# Altium project V3_Board.PrjPcb (part 3 of 9)

## Sheet Reverse Protection_Section.SchDoc
size A4; DocumentNumber: 3; SheetNumber: 3; SheetTotal: 17
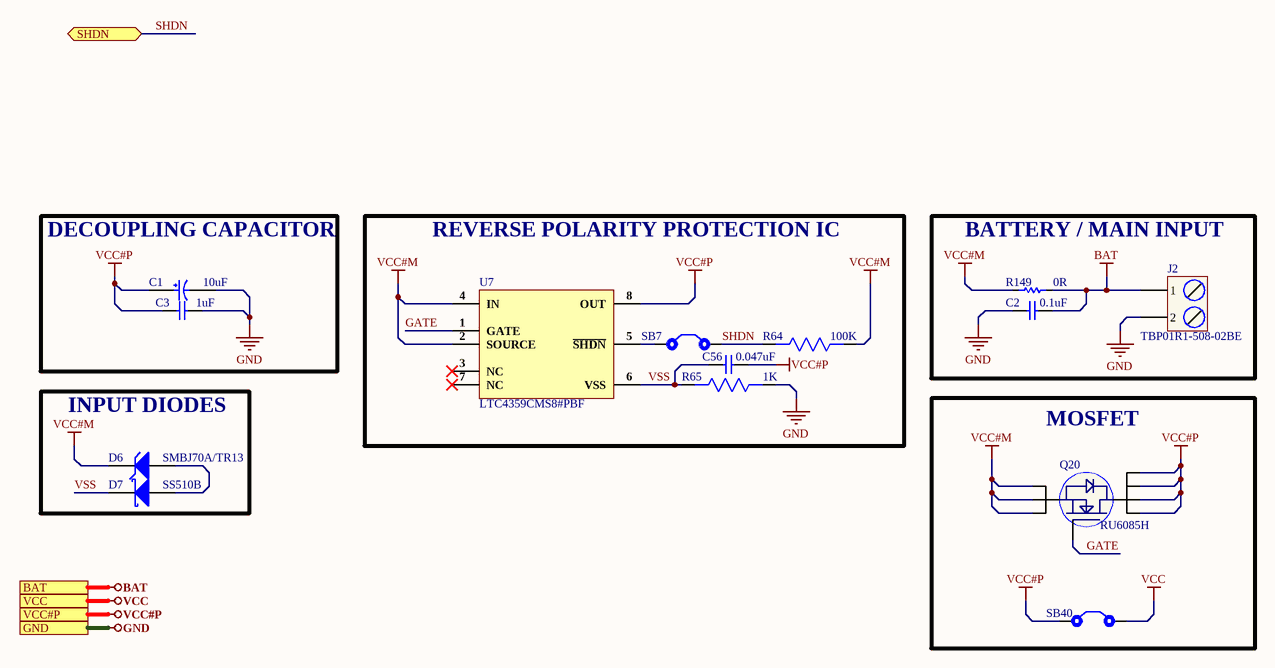
[diagram p5: Reverse Protection_Section.SchDoc]

### Parts
C1  10uF  [RVT1E100M0405.]
C2  0.1uF  [Cap-1206]
C3  1uF  [Cap0603]
C56  0.047uF  [Cap-1206]
D6  SMBJ70A/TR13  [SMB]
D7  SS510B  [SS510B]
J2  TBP01R1-508-02BE  [TBP01R1-508-02BE]
Q20  RU6085H  [RU6085H]
R64  100K  [RES-0805]
R65  1K  [Res-1206]
R149  0R  [RES-2512]
SB7  Solder Bridge  [Solder Bridge]  (value not drawn)
SB40  Solder Bridge  [Solder Bridge]  (value not drawn)
U7  LTC4359CMS8#PBF  [LTC4359CMS8#PBF]

### Blocks framed on the sheet
DECOUPLING CAPACITOR: C1 C3
REVERSE POLARITY PROTECTION IC: C56 R64 R65 SB7 U7
BATTERY / MAIN INPUT: C2 J2 R149
INPUT DIODES: D6 D7
MOSFET: Q20 SB40

### Ports
BAT, GND, SHDN (bidir), VCC, VCC#P

### Nets
BAT: C2.2 J2.1 R149.2 ; port BAT
GND: C1.2 C2.1 C3.2 J2.2 R65.1 ; port GND
VCC: SB40.2 ; port VCC
VCC#M: D6.1(K) Q20.1(S) Q20.2(S) Q20.3(S) R64.1 R149.1 U7.2(SOURCE) U7.4(IN)
VCC#P: C1.1 C3.1 C56.2 Q20.5(D) Q20.6(D) Q20.7(D) Q20.8(D) SB40.1 U7.8(OUT) ; port VCC#P
GATE: Q20.4(G) U7.1(GATE)
SHDN: R64.2 SB7.2 ; port SHDN
VSS: C56.1 D7.1(K) R65.2 U7.6(VSS)
NetD6_2: D6.2(A) D7.2(A)
NetSB7_1: SB7.1 U7.5(~{SHDN})

Not connected (* = marked no-connect by the designer): U7 3(NC)* 7(NC)*

### Library data of the parts
C1 = RVT1E100M0405: CAP ALUM 10uF 25V SMD; Manufacturer: ROQANG; φD: 4mm; L: 5.4mm; Tolerance: ±20%; Operating Temperature: -45℃~+105℃; Rated Voltage: 25V; Capacitance: 10uF
C2 = CC1206KKX7R0BB104: CAP CER 0.1UF 100V X7R 1206; Manufacturer: Yageo; Dielectric Material: Ceramic; Tolerance: 10%; Voltage: 63V; Capacitance: 100nF; Item Type: Capacitor; Supplier 1: Avnet; Manufacturer Part Number: CC1206KKX7R0BB104; RoHS: Yes; Category: Ceramic Capacitors; Stock 1: 24000; Pricing 1: 3000=0.01588, 6000=0.01565, 12000=0.01520, 18000=0.01486, 24000=0.01429, 30000=0.01395, 300000=0.01361 (USD); Mount: Surface Mount; Case/Package: 1206; Number of Pins: 2; Case Code (Metric): 3216; Case Code (Imperial): 1206; Min Operating Temperature: -55°C; Max Operating Temperature: 125°C; Dielectric: X7R; Package Quantity: 1; Voltage Rating: 100V; Packaging: Tape and Reel; Voltage Rating (DC): 100V; Termination: SMD/SMT; Resistor Type: Ceramic; Series: CC; Length: 3.2mm; Width: 0.063inch; Height: 1.25mm; Thickness: 0.057inch; Depth: 1.6mm; Radiation Hardening: No; RoHS Compliant: Yes; Reach SVHC Compliant: Yes; Lead Free: Lead Free; ComponentLink1URL: https://datasheet.ciiva.com/7978/1447671-7978227.pdf?src-supplier=Element14; ComponentLink1Description: https://datasheet.ciiva.com/7978/1447671-7978227.pdf?src-supplier=Element14; ComponentLink2URL: https://datasheet.ciiva.com/46391/1919308-46391993.pdf?src-supplier=Element14; ComponentLink2Description: https://datasheet.ciiva.com/46391/1919308-46391993.pdf?src-supplier=Element14; ComponentLink3URL: https://datasheet.ciiva.com/180/mlccorderingcode-180145.pdf?src-supplier=Digi-Key; ComponentLink3Description: https://datasheet.ciiva.com/180/mlccorderingcode-180145.pdf?src-supplier=Digi-Key; ComponentLink4URL: https://datasheet.ciiva.com/180/mlccorderingcode-180144.pdf?src-supplier=Digi-Key; ComponentLink4Description: https://datasheet.ciiva.com/180/mlccorderingcode-180144.pdf?src-supplier=Digi-Key; ComponentLink5URL: https://datasheet.ciiva.com/180/mlccorderingcode-180146.pdf?src-supplier=Digi-Key; ComponentLink5Description: https://datasheet.ciiva.com/180/mlccorderingcode-180146.pdf?src-supplier=Digi-Key; ComponentLink6URL: https://datasheet.ciiva.com/5425/upy-gp-np0-16v-to-50v-8-5425573.pdf?src-supplier=Mouser; ComponentLink6Description: https://datasheet.ciiva.com/5425/upy-gp-np0-16v-to-50v-8-5425573.pdf?src-supplier=Mouser; ComponentLink7URL: https://datasheet.ciiva.com/16981/upy-np0x7r-mv-100-to-630v-9-16981180.pdf?src-supplier=Future+Electronics; ComponentLink7Description: https://datasheet.ciiva.com/16981/upy-np0x7r-mv-100-to-630v-9-16981180.pdf?src-supplier=Future+Electronics; ComponentLink8URL: https://datasheet.ciiva.com/26829/getdatasheetpartid-403790-26829655.pdf?src-supplier=Verical; ComponentLink8Description: https://datasheet.ciiva.com/26829/getdatasheetpartid-403790-26829655.pdf?src-supplier=Verical; Supplier Part Number 1: CC1206KKX7R0BB104; LCSC Part Number: C107181
C3 = CC0603KRX5R8BB105: CAP CER 1UF 25V X5R 0603; Manufacturer: Yageo; Tolerance: 10%; Supplier 1: Digi-Key; Manufacturer Part Number: CC0603KRX5R8BB105; Stock 1: 1419041; Pricing 1: 1=0.1, 10=0.069, 100=0.0307, 500=0.0219, 1000=0.0172 (USD); Mount: Surface Mount; Case/Package: 0603; Number of Pins: 2; Case Code (Metric): 1608; Case Code (Imperial): 0603; Min Operating Temperature: -55°C; Max Operating Temperature: 85°C; Capacitance: 1uF; Dielectric: X5R; Package Quantity: 1; Voltage Rating: 25V; Packaging: Tape and Reel; Termination: SMD/SMT; Voltage Rating (DC): 25V; Length: 1.6mm; Height: 0.8mm; Width: 0.031inch; Thickness: 0.035inch; Depth: 0.8mm; Radiation Hardening: No; REACH SVHC: No SVHC; Lead Free: Lead Free; Halogen Free: Halogen Free; ComponentLink1URL: http://www.yageo.com/documents/recent/UPY-GPHC_X5R_4V-to-50V_25.pdf?src-supplier=Digi-Key; ComponentLink1Description: http://www.yageo.com/documents/recent/UPY-GPHC_X5R_4V-to-50V_25.pdf?src-supplier=Digi-Key; ComponentLink2URL: http://www.yageo.com/documents/recent/UPY-GPHC_X5R_4V-to-50V_12.pdf?src-supplier=Avnet+Europe; ComponentLink2Description: http://www.yageo.com/documents/recent/UPY-GPHC_X5R_4V-to-50V_12.pdf?src-supplier=Avnet+Europe; ComponentLink3URL: http://www.farnell.com/datasheets/1525783.pdf?src-supplier=Element14; ComponentLink3Description: http://www.farnell.com/datasheets/1525783.pdf?src-supplier=Element14; ComponentLink4URL: http://www.yageo.com/documents/recent/UPY-GPHC_X5R_4V-to-50V_12.pdf?src-supplier=Avnet; ComponentLink4Description: http://www.yageo.com/documents/recent/UPY-GPHC_X5R_4V-to-50V_12.pdf?src-supplier=Avnet; Supplier Part Number 1: 311-1445-6-ND
C56 = CC1206JRX7R0BB473: CAP CER 0.047UF 100V X7R 1206; Manufacturer: Yageo; Tolerance: 5%; Capacitance: 47nF; Item Type: Capacitor; Supplier 1: Arrow Electronics; Manufacturer Part Number: CC1206JRX7R0BB473; RoHS: Yes; Category: Ceramic Capacitors; Stock 1: 6600; Pricing 1: 1=0.21620, 10=0.10530, 25=0.10420, 100=0.08480, 250=0.08390, 500=0.05860, 1000=0.05090, 3000=0.04900, 6000=0.02930 (USD); Mount: Surface Mount; Case/Package: 1206; Case Code (Imperial): 1206; Case Code (Metric): 3216; Min Operating Temperature: -55°C; Max Operating Temperature: 125°C; Packaging: Tape and Reel; Voltage Rating (DC): 100V; Dielectric: X7R; Termination: SMD/SMT; Resistor Type: Ceramic; Voltage Rating: 100V; Series: CC; Construction: Flat; Length: 3.2mm; Width: 1.6mm; Height: 0.85mm; Thickness: 0.037inch; Depth: 1.6mm; Radiation Hardening: No; RoHS Compliant: Yes; ComponentLink1URL: https://datasheet.ciiva.com/11465/upy-np0x7r-mv-100-to-630v-9-11465413.pdf?src-supplier=Avnet; ComponentLink1Description: https://datasheet.ciiva.com/11465/upy-np0x7r-mv-100-to-630v-9-11465413.pdf?src-supplier=Avnet; ComponentLink2URL: https://datasheet.ciiva.com/13210/upy-gp-np0-16v-to-50v-8-13210277.pdf?src-supplier=Mouser; ComponentLink2Description: https://datasheet.ciiva.com/13210/upy-gp-np0-16v-to-50v-8-13210277.pdf?src-supplier=Mouser; Supplier Part Number 1: CC1206JRX7R0BB473; LCSC Part Number: C577197
D6 = SMBJ70A/TR13: 1uA 5.3A 113V 77.8V 70V 86V Unidirectional SMB(DO-214AA) TVS ROHS; Manufacturer: Brightking; Manufacturer Part Number: SMBJ70A/TR13; Footprint: SMB(DO-214AA); ComponentLink1Description: LCSC; ComponentLink1URL: https://www.lcsc.com/product-detail/TVS_Brightking-SMBJ70A-TR13_C309982.html
D7 = SS510B: SCHOTTKY DIODE SMB 100V 5A; Manufacturer: MDD; Manufacturer Part Number: SS510B; Footprint: SMB; ComponentLink1Description: LCSC; ComponentLink1URL: https://lcsc.com/product-detail/Schottky-Barrier-Diodes-SBD_WEIDA-SS510B_C2915231.html
J2 = TBP01R1-508-02BE: TERMINAL BLOCK, PLUGGABLE, 5.08,; Manufacturer: CUI Devices; Supplier 1: Arrow Electronics; Manufacturer Part Number: TBP01R1-508-02BE; RoHS: Yes; Category: Terminal Blocks; Stock 1: 1821; Pricing 1: 1=0.57450, 10=0.23530, 25=0.18730, 50=0.17170, 100=0.16040, 400=0.14010, 800=0.12060, 1200=0.11290 (USD); Supplier Part Number 1: TBP01R1-508-02BE
Q20 = RU6085H: 60V 80A 2.5W 7mΩ@10V,20A 3V@250μA N Channel SOP-8_150mil MOSFETs ROHS; Manufacturer: Shenzhen; Manufacturer Part Number: RU6085H; Footprint: SOP-8_150mil; ComponentLink1Description: LCSC; ComponentLink1URL: https://lcsc.com/product-detail/MOSFETs_Shenzhen-ruichips-Semicon-RU6085H_C181990.html
R64 = RC0805FR-07100KL: RES 100K OHM 1% 1/8W 0805; Manufacturer: Yageo; Resistance: 100kR; Power Rating: 125mW; Voltage Rating (DC): 150V; Temperature Coefficient: 100ppm/°C; Item Type: Resistor; Supplier 1: Avnet; Manufacturer Part Number: RC0805FR-07100KL; RoHS: Yes; Category: Chip SMD Resistors; Stock 1: 695000; Pricing 1: 5000=0.00227, 10000=0.00224, 20000=0.00217 (USD); Case/Package: 0805; Number of Pins: 2; Case Code (Metric): 2012; Case Code (Imperial): 0805; Size Code: 0805; Min Operating Temperature: -55°C; Max Operating Temperature: 155°C; Resistor Type: Thick Film; Tolerance: 1%; Packaging: Tape and Reel; Voltage Rating: 150V; Package Quantity: 1; Number of Terminations: 2; Termination: SMD/SMT; Max Power Dissipation: 125mW; Features: Moisture Resistant; Series: RC; Construction: Rectangular; Resistance Tolerance: 1%; Technology: THICK FILM; Length: 0.079inch; Width: 0.049inch; Height: 0.024inch; Depth: 1.25mm; Lead Pitch: 0.4mm; Lead Free: Lead Free; RoHS Compliant: Yes; Military Standard: Not; ComponentLink1URL: https://datasheet.ciiva.com/11808/0900766b8106beab-11808858.pdf?src-supplier=RSComponents; ComponentLink1Description: https://datasheet.ciiva.com/11808/0900766b8106beab-11808858.pdf?src-supplier=RSComponents; ComponentLink2URL: https://datasheet.ciiva.com/7941/1686128-7941677.pdf?src-supplier=Element14; ComponentLink2Description: https://datasheet.ciiva.com/7941/1686128-7941677.pdf?src-supplier=Element14; ComponentLink3URL: https://datasheet.ciiva.com/7660/38627-7660796.pdf?src-supplier=Element14; ComponentLink3Description: https://datasheet.ciiva.com/7660/38627-7660796.pdf?src-supplier=Element14; ComponentLink4URL: https://datasheet.ciiva.com/22747/444164-22747534.pdf?src-supplier=Element14; ComponentLink4Description: https://datasheet.ciiva.com/22747/444164-22747534.pdf?src-supplier=Element14; ComponentLink5URL: https://datasheet.ciiva.com/2457/pyu-r-int-thick-7-2457018.pdf?src-supplier=Digi-Key; ComponentLink5Description: https://datasheet.ciiva.com/2457/pyu-r-int-thick-7-2457018.pdf?src-supplier=Digi-Key; ComponentLink6URL: https://datasheet.ciiva.com/2457/pyu-r-int-thick-7-2457019.pdf?src-supplier=Digi-Key; ComponentLink6Description: https://datasheet.ciiva.com/2457/pyu-r-int-thick-7-2457019.pdf?src-supplier=Digi-Key; ComponentLink7URL: https://datasheet.ciiva.com/2457/pyu-r-int-thick-7-2457017.pdf?src-supplier=Digi-Key; ComponentLink7Description: https://datasheet.ciiva.com/2457/pyu-r-int-thick-7-2457017.pdf?src-supplier=Digi-Key; ComponentLink8URL: https://datasheet.ciiva.com/12667/rc0805-12667001.pdf?src-supplier=Mouser; ComponentLink8Description: https://datasheet.ciiva.com/12667/rc0805-12667001.pdf?src-supplier=Mouser; ComponentLink9URL: https://datasheet.ciiva.com/7941/1697719-7941676.pdf?src-supplier=Element14; ComponentLink9Description: https://datasheet.ciiva.com/7941/1697719-7941676.pdf?src-supplier=Element14; ComponentLink10URL: https://datasheet.ciiva.com/7941/1697719-7941678.pdf?src-supplier=Element14; ComponentLink10Description: https://datasheet.ciiva.com/7941/1697719-7941678.pdf?src-supplier=Element14; ComponentLink11URL: https://datasheet.ciiva.com/16747/rc0805-16747226.pdf?src-supplier=Future+Electronics; ComponentLink11Description: https://datasheet.ciiva.com/16747/rc0805-16747226.pdf?src-supplier=Future+Electronics; Supplier Part Number 1: RC0805FR-07100KL; LCSC Part Number: C96346
R65 = RC1206FR-7W1KL: RES 1K OHM 1% 1/2W 1206; Manufacturer: Yageo; Item Type: Resistor; Supplier 1: Digi-Key; Manufacturer Part Number: RC1206FR-7W1KL; RoHS: Yes; Category: Chip SMD Resistors; Stock 1: 6215; Pricing 1: 1=0.19000, 10=0.15700, 100=0.06150, 1000=0.02572, 2500=0.02358 (USD); RoHS Compliant: Yes; Supplier Part Number 1: 13-RC1206FR-7W1KLCT-ND; LCSC Part Number: C859155; ComponentLink1Description: LCSC; ComponentLink1URL: https://www.lcsc.com/product-detail/Chip-Resistor-Surface-Mount_YAGEO-RC1206FR-7W1KL_C859155.html
R149 = 25121WJ0000T4E: 1W Thick Film Resistors ±5% ±800ppm/℃ 0Ω 2512 Chip Resistor - Surface Mount ROHS; Manufacturer: UNI-ROYAL; Manufacturer Part Number: 25121WJ0000T4E; Package: 2512; LCSC Part Number: C25469; Item Type: Resistor; ComponentLink1Description: LCSC; ComponentLink1URL: https://www.lcsc.com/product-detail/Chip-Resistor-Surface-Mount_UNI-ROYAL-Uniroyal-Elec-25121WJ0000T4E_C25469.html
SB7 SB40 = Solder Bridge: Solder Bridge ON
U7 = LTC4359CMS8#PBF: IC OR CTRLR N+1 8MSOP; Manufacturer: Analog Devices / Linear Technology; Max Supply Voltage: 80V; Max Output Current: 180mA; Min Supply Voltage: 4V; Turn-On Delay Time: 200us; Turn-Off Delay Time: 300ns; Operating Supply Current: 150uA; Number of Drivers: 1; Supplier 1: Mouser; Manufacturer Part Number: LTC4359CMS8#PBF; RoHS: Yes; Category: Power Management ICs; Stock 1: 57; Pricing 1: 1=4.95000, 10=4.44000, 50=4.19000, 100=3.63000, 1000=3.09000, 10000=3.09000 (USD); Case/Package: MSOP; Number of Pins: 8; Min Operating Temperature: 0°C; Max Operating Temperature: 70°C; Package Quantity: 50; Packaging: Rail/Tube; Lead Free: Lead Free; ComponentLink1URL: https://datasheet.ciiva.com/6609/4359fb-6609306.pdf?src-supplier=Digi-Key; ComponentLink1Description: https://datasheet.ciiva.com/6609/4359fb-6609306.pdf?src-supplier=Digi-Key; Supplier Part Number 1: 584-LTC4359CMS8#PBF

## Sheet Solar_Charge_Controller.SchDoc
size A3
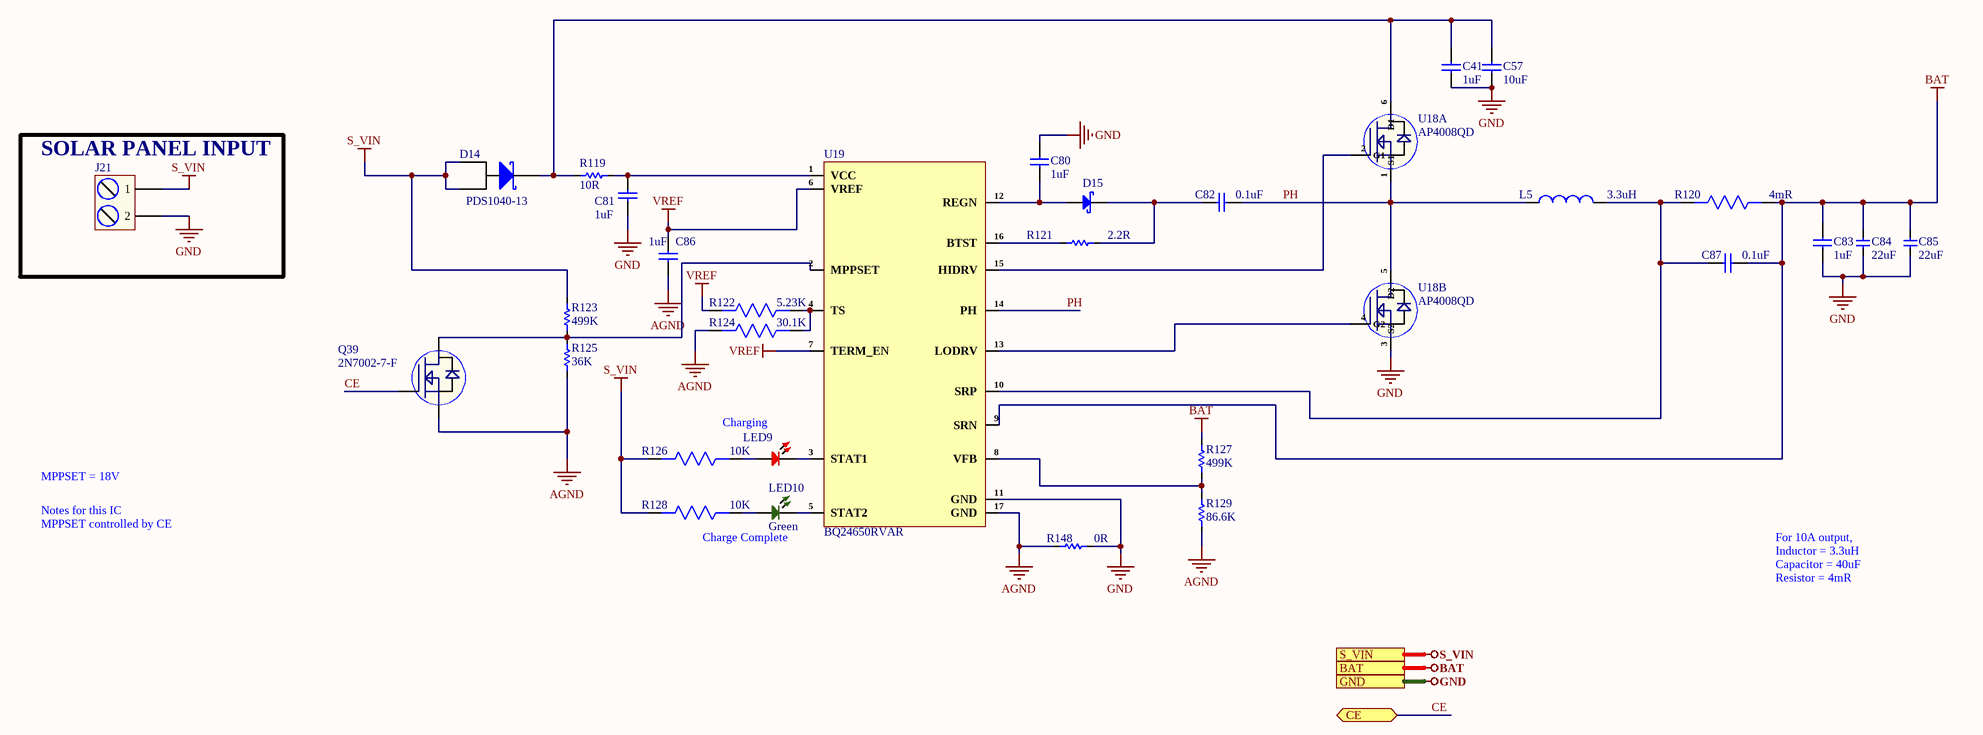
[diagram p6: Solar_Charge_Controller.SchDoc]

### Parts
C41  1uF  [Cap0402]
C57  10uF  [Cap0603]
C80  1uF  [Cap0402]
C81  1uF  [Cap0402]
C82  0.1uF  [Cap0603]
C83  1uF  [Cap0402]
C84  22uF  [Cap-0805]
C85  22uF  [Cap-0805]
C86  1uF  [Cap0402]
C87  0.1uF  [Cap0603]
D14  PDS1040-13  [PowerDI™ 5]
D15  ZLLS350TA  [SOD-523]  (value not drawn)
J21  TBP01R1-508-02BE  [TBP01R1-508-02BE]  (value not drawn)
L5  3.3uH  [YSPI1040-3R3M]
LED9  RED  [LED-0603]  (value not drawn)
LED10  Green  [LED-0402]
Q39  2N7002-7-F  [SOT23-3]
R119  10R  [RES-0805]
R120  4mR  [RES 2512]
R121  2.2R  [Res-0402]
R122  5.23K  [RES-0603]
R123  499K  [Res-0402]
R124  30.1K  [RES-0603]
R125  36K  [Res-0402]
R126  10K  [Res-0603]
R127  499K  [Res-0603]
R128  10K  [Res-0603]
R129  86.6K  [Res-0402]
R148  0R  [RES-2512]
U18  AP4008QD  [PDFN3x3]  (parts A,B of 2)
U19  BQ24650RVAR  [QFN-16-EP(3.6x3.6)]

### Blocks framed on the sheet
SOLAR PANEL INPUT: J21

### Ports
BAT, CE (bidir), GND, S_VIN

### Nets
AGND: C86.1 Q39.2(S) R124.2 R125.1 R129.1 R148.1 U19.17(GND)
BAT: C83.2 C84.2 C85.2 C87.2 R120.1 R127.2 U19.9(SRN) ; port BAT
GND: C41.1 C57.1 C80.2 C81.1 C83.1 C84.1 C85.1 J21.2 R148.2 U18.3(S2) U19.11(GND) ; port GND
S_VIN: D14.1(A1) D14.2(A2) J21.1 R123.2 R126.2 R128.2 ; port S_VIN
VREF: C86.2 R122.2 U19.6(VREF) U19.7(TERM_EN)
CE: Q39.1(G) ; port CE
PH: C82.2 L5.1 U18.1(S1) U18.5(D2) U19.14(PH)
NetC41_2: C41.2 C57.2 D14.3(K) R119.1 U18.6(D1)
NetC80_1: C80.1 D15.1(A) U19.12(REGN)
NetC81_2: C81.2 R119.2 U19.1(VCC)
NetC82_1: C82.1 D15.2(K) R121.2
NetC87_1: C87.1 L5.2 R120.2 U19.10(SRP)
NetLED9_1: LED9.1 R126.1
NetLED9_2: LED9.2 U19.3(STAT1)
NetLED10_1: LED10.1 R128.1
NetLED10_2: LED10.2 U19.5(STAT2)
NetQ39_3: Q39.3(D) R123.1 R125.2 U19.2(MPPSET)
NetR121_1: R121.1 U19.16(BTST)
NetR122_1: R122.1 R124.1 U19.4(TS)
NetR127_1: R127.1 R129.2 U19.8(VFB)
NetU18_2: U18.2(G1) U19.15(HIDRV)
NetU18_4: U18.4(G2) U19.13(LODRV)

### Notes on the sheet
- (near U19) Charging
- MPPSET = 18V
- Notes for this IC
  MPPSET controlled by CE
- Charge Complete
- For 10A output,
  Inductor = 3.3uH
  Capacitor = 40uF
  Resistor = 4mR

### Library data of the parts
C41 C80 C81 C83 C86 = UMK105CBJ105MV-F: CAP CER 1UF 50V X5R 0402; Manufacturer: Taiyo Yuden; Supplier 1: Digi-Key; Manufacturer Part Number: UMK105CBJ105MV-F; Stock 1: 412061; Pricing 1: 1=0.27, 10=0.184, 50=0.1224, 100=0.104, 500=0.07342, 1000=0.06424, 2500=0.06118, 5000=0.05659 (USD); Lead Free: Lead Free; RoHS Compliant: Yes; ComponentLink1URL: http://www.farnell.com/datasheets/2801300.pdf?src-supplier=Newark; ComponentLink1Description: http://www.farnell.com/datasheets/2801300.pdf?src-supplier=Newark; ComponentLink2URL: http://www.farnell.com/datasheets/2801300.pdf?src-supplier=Farnell; ComponentLink2Description: http://www.farnell.com/datasheets/2801300.pdf?src-supplier=Farnell; ComponentLink3URL: https://ds.yuden.co.jp/TYCOMPAS/ut/detail?pn=UMK105CBJ105MV-F &amp;u=M&src-supplier=Digi-Key; ComponentLink3Description: https://ds.yuden.co.jp/TYCOMPAS/ut/detail?pn=UMK105CBJ105MV-F &amp;u=M&src-supplier=Digi-Key; Supplier Part Number 1: 587-6278-1-ND
C57 = GRM188R6YA106MA73D: CAP CER 10UF 35V X5R 0603; Manufacturer: Murata; Tolerance: 20%; Supplier 1: Arrow Electronics; Manufacturer Part Number: GRM188R6YA106MA73D; RoHS: Yes; Category: Ceramic Capacitors; Stock 1: 38881; Pricing 1: 1=0.36820, 10=0.23680, 25=0.23460, 100=0.15100, 250=0.14950, 500=0.10790, 1000=0.09360, 3000=0.08750, 6000=0.07770, 15000=0.07250, 30000=0.06740 (USD); Mount: Surface Mount; Case/Package: 0603; Case Code (Metric): 1608; Case Code (Imperial): 0603; Min Operating Temperature: -55°C; Max Operating Temperature: 85°C; Packaging: Tape and Reel; Capacitance: 10uF; Voltage Rating: 35V; Voltage Rating (DC): 35V; Dielectric: X5R; Length: 0.063inch; Width: 0.031inch; Thickness: 0.039inch; RoHS Compliant: Yes; ComponentLink1URL: http://search.murata.co.jp/Ceramy/image/img/A01X/G101/ENG/GRM188R6YA106MA73-01.pdf?src-supplier=Future+Electronics; ComponentLink1Description: http://search.murata.co.jp/Ceramy/image/img/A01X/G101/ENG/GRM188R6YA106MA73-01.pdf?src-supplier=Future+Electronics; ComponentLink2URL: http://search.murata.co.jp/Ceramy/image/img/A01X/G101/ENG/GRM188R6YA106MA73-01.pdf?src-supplier=Digi-Key; ComponentLink2Description: http://search.murata.co.jp/Ceramy/image/img/A01X/G101/ENG/GRM188R6YA106MA73-01.pdf?src-supplier=Digi-Key; ComponentLink3URL: https://www.murata.com/~/media/webrenewal/support/library/catalog/products/capacitor/mlcc/c02e.ashx?la=en-us&src-supplier=Digi-Key; ComponentLink3Description: https://www.murata.com/~/media/webrenewal/support/library/catalog/products/capacitor/mlcc/c02e.ashx?la=en-us&src-supplier=Digi-Key; ComponentLink4URL: http://search.murata.co.jp/Ceramy/image/img/A01X/G101/ENG/GRM188R6YA106MA73-01.pdf?src-supplier=Mouser; ComponentLink4Description: http://search.murata.co.jp/Ceramy/image/img/A01X/G101/ENG/GRM188R6YA106MA73-01.pdf?src-supplier=Mouser; ComponentLink5URL: http://search.murata.co.jp/Ceramy/image/img/A01X/G101/ENG/GRM188R6YA106MA73-01.pdf?src-supplier=TTI; ComponentLink5Description: http://search.murata.co.jp/Ceramy/image/img/A01X/G101/ENG/GRM188R6YA106MA73-01.pdf?src-supplier=TTI; Supplier Part Number 1: GRM188R6YA106MA73D
C82 C87 = CC0603ZRY5V9BB104: CAP CER 0.1UF 50V Y5V 0603; Manufacturer: Yageo; Capacitance: 100nF; Tolerance: 80%; Supplier 1: Digi-Key; Manufacturer Part Number: CC0603ZRY5V9BB104; Stock 1: 15000880; Pricing 1: 1=0.1, 10=0.075, 100=0.0334, 500=0.02386, 1000=0.01874 (USD); Mount: Surface Mount; Case/Package: 0603; Number of Pins: 2; Case Code (Metric): 1608; Case Code (Imperial): 0603; Min Operating Temperature: -30°C; Max Operating Temperature: 85°C; Dielectric: Y5V; Voltage Rating: 50V; Package Quantity: 1; Packaging: Tape and Reel; Voltage Rating (DC): 50V; Termination: SMD/SMT; Composition: Ceramic; Voltage: 50V; Length: 1.6mm; Height: 0.8mm; Width: 0.031inch; Thickness: 0.035inch; Depth: 0.8mm; Radiation Hardening: No; REACH SVHC: No SVHC; Lead Free: Lead Free; Halogen Free: Halogen Free; ComponentLink1URL: http://www.yageo.com/documents/recent/UPY-GPHC_Y5V_6.3V-to-50V_8.pdf?src-supplier=Digi-Key; ComponentLink1Description: http://www.yageo.com/documents/recent/UPY-GPHC_Y5V_6.3V-to-50V_8.pdf?src-supplier=Digi-Key; ComponentLink2URL: http://www.yageo.com/documents/recent/UPY-GPHC_Y5V_6.3V-to-50V_5.pdf?src-supplier=Avnet+Europe; ComponentLink2Description: http://www.yageo.com/documents/recent/UPY-GPHC_Y5V_6.3V-to-50V_5.pdf?src-supplier=Avnet+Europe; ComponentLink3URL: https://www.verical.com/server-webapp/html/getDatasheet?partID=403611&src-supplier=Verical; ComponentLink3Description: https://www.verical.com/server-webapp/html/getDatasheet?partID=403611&src-supplier=Verical; ComponentLink4URL: http://www.mouser.com/ds/2/447/Yageo_UPY-GP_NP0_16V-to-50V_9-358835.pdf?src-supplier=Mouser; ComponentLink4Description: http://www.mouser.com/ds/2/447/Yageo_UPY-GP_NP0_16V-to-50V_9-358835.pdf?src-supplier=Mouser; ComponentLink5URL: http://www.farnell.com/datasheets/1132289.pdf?src-supplier=Element14; ComponentLink5Description: http://www.farnell.com/datasheets/1132289.pdf?src-supplier=Element14; Supplier Part Number 1: 311-1343-1-ND
C84 C85 = C2012X5R1V226MT000E: CAP CER 22UF 35V X5R 0805; Manufacturer: TDK Corporation; Item Type: Capacitor; Manufacturer Part Number: C2012X5R1V226MT000E; Package: 0805; ComponentLink1Description: LCSC; ComponentLink1URL: https://www.lcsc.com/product-detail/Multilayer-Ceramic-Capacitors-MLCC-SMD-SMT_TDK-C2012X5R1V226M125AC_C2179409.html; LCSC Part Number: C338080
D14 = PDS1040-13: DIODE SCHOTTKY 40V 10A POWERDI5; Manufacturer: Diodes; Element Configuration: Common Anode; Max Reverse Current: 700uA; Peak Non-Repetitive Surge Current: 275A; Forward Voltage: 510mV; Polarity: Standard; Supplier 1: RSComponents; Manufacturer Part Number: PDS1040-13; RoHS: Yes; Category: Rectifier Diodes; Stock 1: 140; Pricing 1: 5=1.28400, 50=1.16000, 250=1.05000, 1250=0.93400, 2500=0.82200 (GBP); Mount: Surface Mount; Number of Pins: 5; Weight: 0.003386oz; Contact Plating: Tin,Matte; Min Operating Temperature: -65°C; Max Operating Temperature: 180°C; Forward Current: 10A; Max Repetitive Reverse Voltage (Vrrm): 40V; Packaging: Tape and Reel; Package Quantity: 5000; Average Rectified Current: 10A; Max Forward Surge Current (Ifsm): 275A; Termination: SMD/SMT; Voltage Rating (DC): 40V; Current Rating: 10A; Output Current: 10A; Max Reverse Voltage (DC): 40V; Series: -; Length: 4.05mm; Width: 5.45mm; Height: 1.15mm; Radiation Hardening: No; REACH SVHC: No SVHC; Lead Free: Lead Free; RoHS Compliant: Yes; ComponentLink1URL: https://datasheet.ciiva.com/34302/1541335-34302410.pdf?src-supplier=Jameco; ComponentLink1Description: https://datasheet.ciiva.com/34302/1541335-34302410.pdf?src-supplier=Jameco; ComponentLink2URL: https://datasheet.ciiva.com/4715/ds30538-79818-4715685.pdf?src-supplier=Mouser; ComponentLink2Description: https://datasheet.ciiva.com/4715/ds30538-79818-4715685.pdf?src-supplier=Mouser; ComponentLink3URL: https://datasheet.ciiva.com/8300/ds30538-8300993.pdf?src-supplier=Avnet; ComponentLink3Description: https://datasheet.ciiva.com/8300/ds30538-8300993.pdf?src-supplier=Avnet; ComponentLink4URL: https://datasheet.ciiva.com/7964/ds30538-7964283.pdf?src-supplier=Element14; ComponentLink4Description: https://datasheet.ciiva.com/7964/ds30538-7964283.pdf?src-supplier=Element14; ComponentLink5URL: https://datasheet.ciiva.com/16215/ds30538-16215597.pdf?src-supplier=Future+Electronics; ComponentLink5Description: https://datasheet.ciiva.com/16215/ds30538-16215597.pdf?src-supplier=Future+Electronics; ComponentLink6URL: https://datasheet.ciiva.com/915/ds30538-915075.pdf?src-supplier=Digi-Key; ComponentLink6Description: https://datasheet.ciiva.com/915/ds30538-915075.pdf?src-supplier=Digi-Key; ComponentLink7URL: https://datasheet.ciiva.com/915/ds30538-915076.pdf?src-supplier=Digi-Key; ComponentLink7Description: https://datasheet.ciiva.com/915/ds30538-915076.pdf?src-supplier=Digi-Key; ComponentLink8URL: https://datasheet.ciiva.com/915/ds30538-915074.pdf?src-supplier=Digi-Key; ComponentLink8Description: https://datasheet.ciiva.com/915/ds30538-915074.pdf?src-supplier=Digi-Key; Supplier Part Number 1: 7514648
D15 = ZLLS350TA: DIODE SCHOTTKY 40V 380MA SOD523; Manufacturer: Diodes Zetex; Forward Current: 650mA; Peak Non-Repetitive Surge Current: 6A; Forward Voltage: 1V; Max Power Dissipation: 357mW; Max Reverse Current: 4uA; Reverse Recovery Time: 1ns; Polarity: Standard; Value: 3.5pF; Diode Type: RECTIFIER; Supplier: Future Electronics; Supplier Part Number: 8115933; Manufacturer Part Number: ZLLS350TA; RoHS: Yes; Category: Schottky Diodes; Stock: 78000; Pricing: 3000=0.102, 9000=0.0979, 12000=0.0969, 30000=0.0937, 45000=0.0906 (USD); Mounting Technology: Surface Mount; Pins: 2; Weight: 3.5E-05oz; Min Operating Temperature: -55°C; Max Operating Temperature: 150°C; Max Repetitive Reverse Voltage (Vrrm): 40V; Packaging: Tape and Reel; Package Quantity: 3000; Max Forward Surge Current (Ifsm): 6A; Average Rectified Current: 380mA; Power Dissipation: 357mW; Termination: SMD/SMT; Voltage Rating (DC): 40V; Power Rating: 357mW; Current Rating: 380mA; Output Current: 380mA; Max Reverse Voltage (DC): 40V; Series: -; Length: 1.3mm; Width: 0.9mm; Height: 0.8mm; Radiation Hardening: No; Lead Free: Lead Free; RoHS Compliant: Yes; ComponentLink1URL: https://datasheet.ciiva.com/4715/zlls350-4715700.pdf?src-supplier=Mouser; ComponentLink1Description: https://datasheet.ciiva.com/4715/zlls350-4715700.pdf?src-supplier=Mouser; ComponentLink2URL: https://datasheet.ciiva.com/4715/zlls350-4715700.pdf?src-supplier=Avnet; ComponentLink2Description: https://datasheet.ciiva.com/4715/zlls350-4715700.pdf?src-supplier=Avnet; ComponentLink3URL: https://datasheet.ciiva.com/914/zlls350-914217.pdf?src-supplier=Digi-Key; ComponentLink3Description: https://datasheet.ciiva.com/914/zlls350-914217.pdf?src-supplier=Digi-Key; ComponentLink4URL: https://datasheet.ciiva.com/914/zlls350-914218.pdf?src-supplier=Digi-Key; ComponentLink4Description: https://datasheet.ciiva.com/914/zlls350-914218.pdf?src-supplier=Digi-Key; ComponentLink5URL: https://datasheet.ciiva.com/914/zlls350-914216.pdf?src-supplier=Digi-Key; ComponentLink5Description: https://datasheet.ciiva.com/914/zlls350-914216.pdf?src-supplier=Digi-Key; LCSC Part Number: C139441; Item Type: Diode
J21 = TBP01R1-508-02BE: as J2 on sheet Reverse Protection_Section; Supplier 1: Arrow Electronics; Manufacturer Part Number: TBP01R1-508-02BE; RoHS: Yes; Category: Terminal Blocks; Stock 1: 1821; Pricing 1: 1=0.57450, 10=0.23530, 25=0.18730, 50=0.17170, 100=0.16040, 400=0.14010, 800=0.12060, 1200=0.11290 (USD); Supplier Part Number 1: TBP01R1-508-02BE
L5 = YSPI1040-3R3M: 11A 3.3uH ±20% 10.8mΩ SMD; Manufacturer: YJYCOIN; ComponentLink1Description: LCSC; ComponentLink1URL: https://lcsc.com/product-detail/Power-Inductors_YJYCOIN-YSPI1040-3R3M_C351102.html; Manufacturer Part Number: YSPI1040-3R3M; Footprint: Custom
LED9 = NCD0603R3: RED LED 0603 Light Emitting Diodes; Manufacturer: Foshan NationStar Optoelectronics; Manufacturer Part Number: NCD0603R3; Package: 0603; Item Type: LED; LCSC Part Number: C3151730; ComponentLink1Description: LCSC; ComponentLink1URL: https://www.lcsc.com/product-detail/Light-Emitting-Diodes-LED_Foshan-NationStar-Optoelectronics-NCD0603R3_C3151730.html
LED10 = 16-213/GHC-YR1S1/3T: Green 520~535nm 0402 Light Emitting Diodes (LED) RoHS; Manufacturer: Everlight Elec; Luminous Intensity (IF=20mA): 112~285mcd; Package: 0402; Illumination Color: Green; Dominant Wavelength / Coordinate rank: 520~535nm; Mounting Type: Surface Mount; Manufacturer Part Number: 16-213/GHC-YR1S1/3T; ComponentLink1Description: LCSC; ComponentLink1URL: https://www.lcsc.com/product-detail/Light-Emitting-Diodes-LED_Everlight-Elec-16-213-GHC-YR1S1-3T_C74338.html; LCSC Part Number: C74338; Item Type: LED
Q39 = 2N7002-7-F: MOSFET N-CH 60V 115MA SOT23-3; Manufacturer: Diodes; Nominal Vgs: 2.5V; Max Power Dissipation: 300mW; Rds On Max: 7.5R; Input Capacitance: 50pF; Number of Elements: 1; Drain to Source Breakdown Voltage: 70V; Gate to Source Voltage (Vgs): 20V; Turn-Off Delay Time: 11ns; Turn-On Delay Time: 7ns; Power Dissipation: 540mW; Element Configuration: Single; Polarity: N-CHANNEL; Rise Time: 3ns; Fall Time: 5.6ns; Supplier 1: RSComponents; Manufacturer Part Number: 2N7002-7-F; RoHS: Yes; Category: MOSFETs; Stock 1: 21000; Pricing 1: 3000=0.03200, 6000=0.03100, 15000=0.02900, 30000=0.02700 (GBP); Mount: Surface Mount; Case/Package: SOT-23; Number of Pins: 3; Weight: 0.000282oz; Contact Plating: Tin,Matte; Min Operating Temperature: -55°C; Max Operating Temperature: 150°C; Drain to Source Voltage (Vdss): 60V; Continuous Drain Current (ID): 115mA; Packaging: Tape and Reel; Package Quantity: 3000; Dual Supply Voltage: 60V; Number of Channels: 1; Drain to Source Resistance: 7.5R; On-State Resistance: 7.5R; Threshold Voltage: 2.5V; Termination: SMD/SMT; Voltage Rating (DC): 60V; Current Rating: 115mA; Series: -; Drain-source On Resistance-Max: 7.5R; Voltage: 60V; Length: 2.9mm; Width: 1.3mm; Height: 1mm; Radiation Hardening: No; REACH SVHC: No SVHC; Lead Free: Lead Free; RoHS Compliant: Yes; ComponentLink1URL: https://datasheet.ciiva.com/15219/getdatasheetpartid-110059-15219667.pdf?src-supplier=Verical; ComponentLink1Description: https://datasheet.ciiva.com/15219/getdatasheetpartid-110059-15219667.pdf?src-supplier=Verical; ComponentLink2URL: https://datasheet.ciiva.com/3304/ds11303-3304385.pdf?src-supplier=Avnet; ComponentLink2Description: https://datasheet.ciiva.com/3304/ds11303-3304385.pdf?src-supplier=Avnet; ComponentLink3URL: https://datasheet.ciiva.com/1188/ds11303-1188363.pdf?src-supplier=Element14; ComponentLink3Description: https://datasheet.ciiva.com/1188/ds11303-1188363.pdf?src-supplier=Element14; ComponentLink4URL: https://datasheet.ciiva.com/22712/1915452-22712375.pdf?src-supplier=Element14; ComponentLink4Description: https://datasheet.ciiva.com/22712/1915452-22712375.pdf?src-supplier=Element14; ComponentLink5URL: https://datasheet.ciiva.com/49020/70437206-49020102.pdf?src-supplier=Allied+Electronics; ComponentLink5Description: https://datasheet.ciiva.com/49020/70437206-49020102.pdf?src-supplier=Allied+Electronics; Supplier Part Number 1: 1220588
R119 = TNPW080510R0FEEA: RES 10 OHM 1% 1/8W 0805; Manufacturer: Vishay; Power Rating: 125mW; Voltage Rating: 150V; Temperature Coefficient: 25ppm/°C; Item Type: Resistor; Supplier 1: Mouser; Manufacturer Part Number: TNPW080510R0FEEA; RoHS: Yes; Category: Chip SMD Resistors; Stock 1: 22670; Pricing 1: 1=0.57000, 10=0.43800, 50=0.43800, 100=0.18500, 500=0.13400, 1000=0.10200, 2500=0.09600, 5000=0.08500, 10000=0.08500 (USD); Mounting Technology: Surface Mount; Case/Package: 0805; Case Code (Imperial): 0805; Case Code (Metric): 2012; Weight: 0.000194oz; Contact Plating: Tin; Min Operating Temperature: -55°C; Max Operating Temperature: 125°C; Value: 10R; Tolerance: 1%; Packaging: Tape and Reel; Resistor Type: Thin Film; Termination: SMD/SMT; Series: TNPW e3; Technology: THIN FILM; Length: 2mm; Width: 1.2mm; Height: 0.45mm; Depth: 1.25mm; Radiation Hardening: No; Lead Free: Lead Free; RoHS Compliant: Yes; ComponentLink1URL: https://datasheet.ciiva.com/16787/70201627-16787918.pdf?src-supplier=Allied+Electronics; ComponentLink1Description: https://datasheet.ciiva.com/16787/70201627-16787918.pdf?src-supplier=Allied+Electronics; Supplier Part Number 1: 71-TNPW080510R0FEEA; LCSC Part Number: C844061
R120 = PA2512FKE7T0R004E: RES 0.004 OHM 1% 3W 2512; Manufacturer: Yageo; Supplier 1: Digi-Key; Manufacturer Part Number: PA2512FKE7T0R004E; RoHS: Yes; Category: Chip SMD Resistors; Stock 1: 1943; Pricing 1: 1=0.89000, 10=0.77600, 25=0.68200, 50=0.62340, 100=0.54100, 250=0.47040, 500=0.39044, 1000=0.31753 (USD); Supplier Part Number 1: YAG6087CT-ND
R121 = RC0402FR-072R2L: RES 2.2 OHM 1% 1/16W 0402; Manufacturer: Yageo; Power Rating: 63mW; Voltage Rating: 50V; Temperature Coefficient: 200ppm/°C; Supplier 1: Digi-Key; Manufacturer Part Number: RC0402FR-072R2L; RoHS: Yes; Category: Chip SMD Resistors; Stock 1: 828995; Pricing 1: 1=0.10000, 10=0.02300, 100=0.00930, 1000=0.00416, 2500=0.00361, 5000=0.00298 (USD); Case/Package: 0402; Number of Pins: 2; Case Code (Imperial): 0402; Case Code (Metric): 1005; Size Code: 0402; Min Operating Temperature: -55°C; Max Operating Temperature: 155°C; Resistor Type: Thick Film; Resistance: 2.2R; Tolerance: 1%; Packaging: Tape and Reel; Termination: SMD/SMT; Voltage Rating (DC): 50V; Features: Moisture Resistant; Series: RC; Max Power Dissipation: 63mW; Number of Terminations: 2; Resistance Tolerance: 1%; Technology: THICK FILM; Length: 1mm; Width: 0.5mm; Height: 0.32mm; Depth: 0.5mm; RoHS Compliant: Yes; REACH SVHC: No SVHC; Lead Free: Lead Free; ComponentLink1URL: https://datasheet.ciiva.com/11808/0900766b80c66297-11808447.pdf?src-supplier=RSComponents; ComponentLink1Description: https://datasheet.ciiva.com/11808/0900766b80c66297-11808447.pdf?src-supplier=RSComponents; ComponentLink2URL: https://datasheet.ciiva.com/7849/1018594-7849944.pdf?src-supplier=Element14; ComponentLink2Description: https://datasheet.ciiva.com/7849/1018594-7849944.pdf?src-supplier=Element14; ComponentLink3URL: https://datasheet.ciiva.com/7849/1018594-7849945.pdf?src-supplier=Element14; ComponentLink3Description: https://datasheet.ciiva.com/7849/1018594-7849945.pdf?src-supplier=Element14; ComponentLink4URL: https://datasheet.ciiva.com/12668/pyu-rc0402-51-rohs-l-6-r-12668221.pdf?src-supplier=Mouser; ComponentLink4Description: https://datasheet.ciiva.com/12668/pyu-rc0402-51-rohs-l-6-r-12668221.pdf?src-supplier=Mouser; ComponentLink5URL: https://datasheet.ciiva.com/17070/pyu-rc0402-51-rohs-l-6-r-17070495.pdf?src-supplier=Future+Electronics; ComponentLink5Description: https://datasheet.ciiva.com/17070/pyu-rc0402-51-rohs-l-6-r-17070495.pdf?src-supplier=Future+Electronics; Supplier Part Number 1: 311-2.20LRCT-ND; LCSC Part Number: C327251
R122 = RTT035231FTP: 100mW 75V  5.23kΩ 0603; Manufacturer: RALEC; ComponentLink1Description: LCSC; ComponentLink1URL: https://lcsc.com/product-detail/Chip-span-style-background-color-ff0-Resistor-span-Surface-Mount_RALEC-RTT035231FTP_C103702.html; Manufacturer Part Number: RTT035231FTP; Footprint: 0603
R123 = RC0402BR-07499KL: RES 499K OHM 0.1% 1/16W 0402; Manufacturer: Yageo; Item Type: Resistor; Supplier: Arrow Electronics; Supplier Part Number: RC0402BR-07499KL; Manufacturer Part Number: RC0402BR-07499KL; RoHS: Yes; Category: Chip SMD Resistors; Stock: 5065; Pricing: 1=0.2812, 10=0.1024, 25=0.1013, 100=0.065, 250=0.0644, 500=0.0615, 1000=0.0541, 3000=0.0457 (USD); RoHS Compliant: Yes; LCSC Part Number: C851813
R124 = 0603WAF3012T5E: 100mW 75V 30.1kΩ 0603; Manufacturer: UNI-ROYAL; ComponentLink1Description: LCSC; ComponentLink1URL: https://lcsc.com/product-detail/Chip-span-style-background-color-ff0-Resistor-span-Surface-Mount_UNI-ROYAL-Uniroyal-Elec-0603WAF3012T5E_C23000.html; Manufacturer Part Number: 0603WAF3012T5E; Footprint: 0603
R125 = RT0402BRD0736KL: RES SMD 36K OHM 0.1% 1/16W 0402; Manufacturer: Yageo; Voltage Rating: 50V; Value: 36kR; Power Rating: 62.5mW; Max Power Dissipation: 63mW; Temperature Coefficient: 25ppm/°C; Item Type: Resistor; Supplier: Arrow Electronics; Supplier Part Number: RT0402BRD0736KL; Manufacturer Part Number: RT0402BRD0736KL; RoHS: Yes; Category: Chip SMD Resistors; Stock: 6118; Pricing: 1=0.3205, 10=0.2411, 25=0.2387, 100=0.1111, 250=0.1093, 500=0.0738, 1000=0.0507, 3000=0.0463, 6000=0.0439 (USD); Case/Package: 0402; Case Code (Metric): 1005; Case Code (Imperial): 0402; Min Operating Temperature: -55°C; Max Operating Temperature: 155°C; Tolerance: 0.1%; Packaging: Tape and Reel; Number of Terminations: 2; Termination: SMD/SMT; Voltage Rating (DC): 50V; Features: Moisture Resistant; Series: RT; Length: 0.039inch; Width: 0.02inch; Height: 0.014inch; Lead Free: Lead Free; RoHS Compliant: Yes; ComponentLink1URL: https://datasheet.ciiva.com/12722/pyu-rt-1-to-0-05-rohs-l-4-12722329.pdf?src-supplier=Mouser; ComponentLink1Description: https://datasheet.ciiva.com/12722/pyu-rt-1-to-0-05-rohs-l-4-12722329.pdf?src-supplier=Mouser; LCSC Part Number: C852742
R126 R128 = RC0603FR-0710KL: RES SMD 10K Ohm 1% 1/10W 0603; Manufacturer: Yageo; Voltage Rating: 75V; Resistance: 10kR; Power Rating: 100mW; Temperature Coefficient: 100ppm/°C; Voltage Rating (DC): 50V; Supplier 1: Digi-Key; Manufacturer Part Number: RC0603FR-0710KL; RoHS: Yes; Category: Chip SMD Resistors; Stock 1: 25249139; Pricing 1: 1=0.10000, 10=0.02400, 100=0.00970, 1000=0.00436, 2500=0.00378 (USD); Case/Package: 0603; Case Code (Imperial): 0603; Case Code (Metric): 1608; Size Code: 0603; Min Operating Temperature: -55°C; Max Operating Temperature: 155°C; Packaging: Tape and Reel; Tolerance: 1%; Resistor Type: Thick Film; Termination: SMD/SMT; Number of Terminations: 2; Max Power Dissipation: 100mW; Features: Moisture Resistant; Series: RC; Construction: Rectangular; Length: 1.6mm; Width: 0.8mm; Height: 0.45mm; Depth: 0.8mm; Military Standard: Not; Lead Free: Lead Free; RoHS Compliant: Yes; ComponentLink1URL: https://datasheet.ciiva.com/7660/38590-7660789.pdf?src-supplier=Element14; ComponentLink1Description: https://datasheet.ciiva.com/7660/38590-7660789.pdf?src-supplier=Element14; Supplier Part Number 1: 311-10.0KHRCT-ND; Number of Pins: 2; Weight: 7.1E-05oz; Resistance Tolerance: 1%; Lead Pitch: 0.3mm; REACH SVHC: Unknown; ComponentLink2URL: https://datasheet.ciiva.com/7983/443971-7983596.pdf?src-supplier=Element14; ComponentLink2Description: https://datasheet.ciiva.com/7983/443971-7983596.pdf?src-supplier=Element14; ComponentLink3URL: https://datasheet.ciiva.com/22747/443971-22747519.pdf?src-supplier=Element14; ComponentLink3Description: https://datasheet.ciiva.com/22747/443971-22747519.pdf?src-supplier=Element14; ComponentLink4URL: https://datasheet.ciiva.com/46440/1868787-46440891.pdf?src-supplier=Element14; ComponentLink4Description: https://datasheet.ciiva.com/46440/1868787-46440891.pdf?src-supplier=Element14; ComponentLink5URL: https://datasheet.ciiva.com/7746/1738695-7746239.pdf?src-supplier=Element14; ComponentLink5Description: https://datasheet.ciiva.com/7746/1738695-7746239.pdf?src-supplier=Element14; ComponentLink6URL: https://datasheet.ciiva.com/15189/getdatasheetpartid-409289-15189591.pdf?src-supplier=Verical; ComponentLink6Description: https://datasheet.ciiva.com/15189/getdatasheetpartid-409289-15189591.pdf?src-supplier=Verical; LCSC Part Number: C98220
R127 = TR0603B499KP0525Z: ±0.1% 100mW Thin Film Resistor 75V 499kΩ 0603 Chip Resistor - Surface Mount ROHS; Manufacturer: Ever Ohms Tech; Manufacturer Part Number: TR0603B499KP0525Z; Value: 499K; ComponentLink1Description: LCSC; ComponentLink1URL: https://lcsc.com/product-detail/Chip-span-style-background-color-ff0-Resistor-span-Surface-Mount_Ever-Ohms-Tech-TR0603B499KP0525Z_C149937.html; Package: 0603
R129 = RT0402BRD0786K6L: RES SMD 86.6KOHM 0.1% 1/16W 0402; Manufacturer: Yageo; Value: 86.6kR; Power Rating: 62.5mW; Voltage Rating: 50V; Max Power Dissipation: 63mW; Temperature Coefficient: 25ppm/°C; Item Type: Resistor; Supplier: Digi-Key; Supplier Part Number: 13-RT0402BRD0786K6LCT-ND; Manufacturer Part Number: RT0402BRD0786K6L; RoHS: Yes; Category: Chip SMD Resistors; Stock: 2259; Pricing: 1=0.38, 10=0.323, 50=0.1704, 100=0.1263, 500=0.07636, 1000=0.05287, 5000=0.04406 (USD); Case/Package: 0402; Case Code (Metric): 1005; Case Code (Imperial): 0402; Min Operating Temperature: -55°C; Max Operating Temperature: 125°C; Package Quantity: 10000; Packaging: Tape and Reel; Tolerance: 0.1%; Number of Terminations: 2; Termination: SMD/SMT; Voltage Rating (DC): 50V; Series: RT; Length: 0.039inch; Width: 0.02inch; Height: 0.014inch; Lead Free: Lead Free; RoHS Compliant: Yes; ComponentLink1URL: https://datasheet.ciiva.com/2582/pyu-rt-1-to-0-05-rohs-l-5-2582513.pdf?src-supplier=Digi-Key; ComponentLink1Description: https://datasheet.ciiva.com/2582/pyu-rt-1-to-0-05-rohs-l-5-2582513.pdf?src-supplier=Digi-Key; LCSC Part Number: C852935
R148 = 25121WJ0000T4E: as R149 on sheet Reverse Protection_Section; Manufacturer Part Number: 25121WJ0000T4E; Package: 2512; LCSC Part Number: C25469; Item Type: Resistor; ComponentLink1Description: LCSC; ComponentLink1URL: https://www.lcsc.com/product-detail/Chip-Resistor-Surface-Mount_UNI-ROYAL-Uniroyal-Elec-25121WJ0000T4E_C25469.html
U18 = AP4008QD: 40V 20A 17mΩ@10V,10A 21W 1.6V@250uA 72pF@20V 2 N-Channel 1.05nF@20V 11nC@10V +150℃@(Tj) PDFN3x3; Manufacturer: ALLPOWER(ShenZhen Quan Li Semiconductor); ComponentLink1Description: LCSC; ComponentLink1URL: https://lcsc.com/product-detail/MOSFETs_ALLPOWER-ShenZhen-Quan-Li-Semiconductor-AP4008QD_C2828588.html; Manufacturer Part Number: AP4008QD
U19 = BQ24650RVAR: IC BATT CHG MULTI-CHEM 16VQFN; Manufacturer: Texas Instruments; Supplier 1: Digi-Key; Manufacturer Part Number: BQ24650RVAR; RoHS: Yes; Category: Battery Management; Stock 1: 8347; Pricing 1: 1=4.95, 10=4.442, 25=4.1996, 100=3.6396, 250=3.453, 500=3.09836, 1000=2.61307 (USD); ComponentLink1URL: https://datasheet.ciiva.com/15115/getdatasheetpartid-517726-15115144.pdf?src-supplier=Verical; ComponentLink1Description: https://datasheet.ciiva.com/15115/getdatasheetpartid-517726-15115144.pdf?src-supplier=Verical; ComponentLink2URL: https://datasheet.ciiva.com/1934/bq24650-1934895.pdf?src-supplier=Digi-Key; ComponentLink2Description: https://datasheet.ciiva.com/1934/bq24650-1934895.pdf?src-supplier=Digi-Key; ComponentLink3URL: https://datasheet.ciiva.com/3214/bq24650-3214319.pdf?src-supplier=Avnet; ComponentLink3Description: https://datasheet.ciiva.com/3214/bq24650-3214319.pdf?src-supplier=Avnet; LCSC Part Number: C53712; Item Type: IC